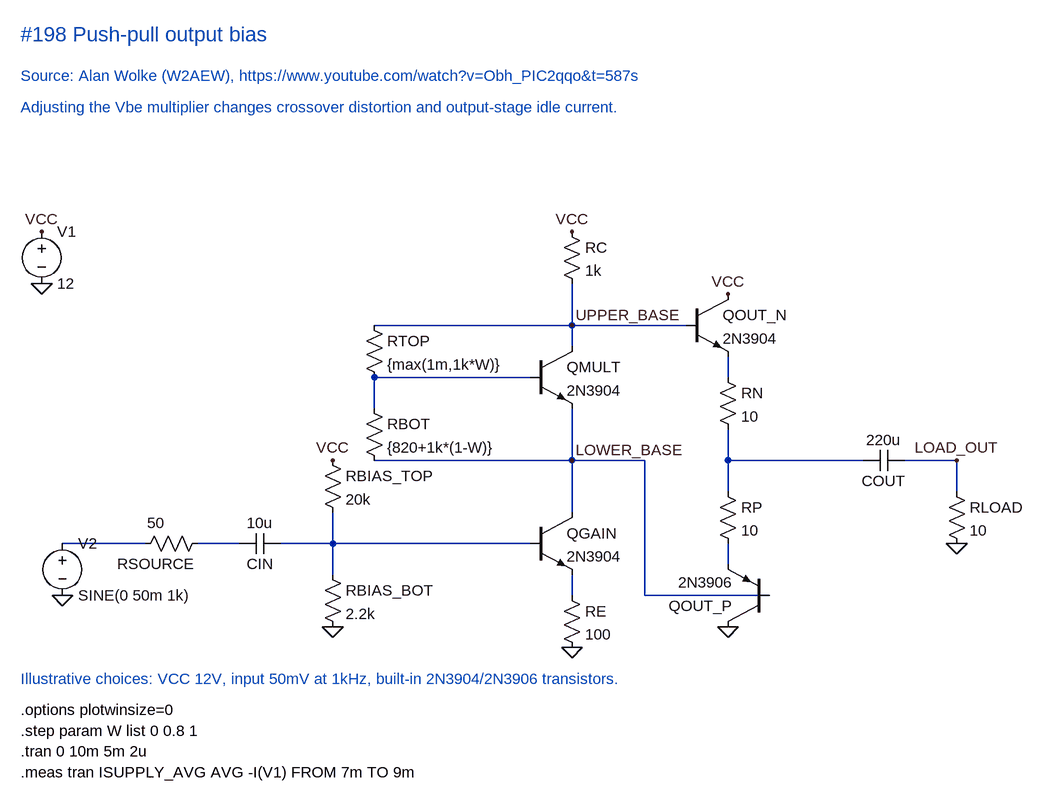
[diagram p0: schematic Push-pull output bias.asc]
Push-pull output bias.asc, the LTspice schematic file:
Version 4.1
SHEET 1 1800 1050
WIRE 256 608 128 608
WIRE 400 608 336 608
WIRE 544 608 464 608
WIRE 848 608 544 608
WIRE 544 608 544 560
WIRE 544 656 544 608
WIRE 912 272 912 208
WIRE 912 304 912 272
WIRE 912 272 608 272
WIRE 1088 272 912 272
WIRE 848 352 608 352
WIRE 608 400 608 352
WIRE 912 480 912 400
WIRE 912 480 608 480
WIRE 912 560 912 480
WIRE 912 688 912 656
WIRE 1024 480 912 480
WIRE 1024 688 1024 480
WIRE 1216 688 1024 688
WIRE 1152 352 1152 320
WIRE 1152 480 1152 432
WIRE 1152 528 1152 480
WIRE 1152 640 1152 608
WIRE 1248 480 1152 480
WIRE 1360 480 1248 480
WIRE 1504 480 1424 480
WIRE 1504 528 1504 480
FLAG 96 128 VCC
FLAG 96 208 0
FLAG 128 688 0
FLAG 544 480 VCC
FLAG 544 736 0
FLAG 912 128 VCC
FLAG 912 768 0
FLAG 1152 224 VCC
FLAG 1152 736 0
FLAG 1504 608 0
FLAG 912 272 UPPER_BASE
FLAG 912 480 LOWER_BASE
FLAG 1504 480 LOAD_OUT
SYMBOL voltage 96 112 R0
SYMATTR InstName V1
SYMATTR Value 12
SYMBOL voltage 128 592 R0
SYMATTR InstName V2
SYMATTR Value SINE(0 50m 1k)
SYMBOL res 240 624 R270
WINDOW 0 0 32 VBottom 2
WINDOW 3 32 32 VTop 2
SYMATTR InstName RSOURCE
SYMATTR Value 50
SYMBOL cap 400 624 R270
WINDOW 0 0 32 VBottom 2
WINDOW 3 32 32 VTop 2
SYMATTR InstName CIN
SYMATTR Value 10u
SYMBOL res 528 464 R0
SYMATTR InstName RBIAS_TOP
SYMATTR Value 20k
SYMBOL res 528 640 R0
SYMATTR InstName RBIAS_BOT
SYMATTR Value 2.2k
SYMBOL npn 848 560 R0
SYMATTR InstName QGAIN
SYMATTR Value 2N3904
SYMBOL res 896 672 R0
SYMATTR InstName RE
SYMATTR Value 100
SYMBOL res 896 112 R0
SYMATTR InstName RC
SYMATTR Value 1k
SYMBOL npn 848 304 R0
SYMATTR InstName QMULT
SYMATTR Value 2N3904
SYMBOL res 592 256 R0
SYMATTR InstName RTOP
SYMATTR Value {max(1m,1k*W)}
SYMBOL res 592 384 R0
SYMATTR InstName RBOT
SYMATTR Value {820+1k*(1-W)}
SYMBOL npn 1088 224 R0
SYMATTR InstName QOUT_N
SYMATTR Value 2N3904
SYMBOL res 1136 336 R0
SYMATTR InstName RN
SYMATTR Value 10
SYMBOL res 1136 512 R0
SYMATTR InstName RP
SYMATTR Value 10
SYMBOL pnp 1216 736 R180
SYMATTR InstName QOUT_P
SYMATTR Value 2N3906
SYMBOL cap 1360 496 R270
WINDOW 0 0 32 VBottom 2
WINDOW 3 32 32 VTop 2
SYMATTR InstName COUT
SYMATTR Value 220u
SYMBOL res 1488 512 R0
SYMATTR InstName RLOAD
SYMATTR Value 10
TEXT 64 -176 Left 3 ;#198 Push-pull output bias
TEXT 64 -112 Left 2 ;Source: Alan Wolke (W2AEW), https://www.youtube.com/watch?v=Obh_PIC2qqo&t=587s
TEXT 64 -64 Left 2 ;Adjusting the Vbe multiplier changes crossover distortion and output-stage idle current.
TEXT 64 816 Left 2 ;Illustrative choices: VCC 12V, input 50mV at 1kHz, built-in 2N3904/2N3906 transistors.
TEXT 64 864 Left 2 !.options plotwinsize=0
TEXT 64 896 Left 2 !.step param W list 0 0.8 1
TEXT 64 928 Left 2 !.tran 0 10m 5m 2u
TEXT 64 960 Left 2 !.meas tran ISUPPLY_AVG AVG -I(V1) FROM 7m TO 9m

The netlist it stands for:
* Push-pull output bias.asc
V1 VCC 0 12
V2 N001 0 SINE(0 50m 1k)
RSOURCE N001 N002 50
CIN N002 N003 10u
RBIAS_TOP VCC N003 20k
RBIAS_BOT N003 0 2.2k
QGAIN LOWER_BASE N003 N005 0 2N3904
RE N005 0 100
RC VCC UPPER_BASE 1k
QMULT UPPER_BASE N004 LOWER_BASE 0 2N3904
RTOP UPPER_BASE N004 {max(1m,1k*W)}
RBOT N004 LOWER_BASE {820+1k*(1-W)}
QOUT_N VCC UPPER_BASE N006 0 2N3904
RN N006 N007 10
RP N007 N008 10
QOUT_P 0 LOWER_BASE N008 0 2N3906
COUT N007 LOAD_OUT 220u
RLOAD LOAD_OUT 0 10
.model NPN NPN
.model PNP PNP
.lib standard.bjt
* #198 Push-pull output bias
* Source: Alan Wolke (W2AEW), https://www.youtube.com/watch?v=Obh_PIC2qqo&t=587s
* Adjusting the Vbe multiplier changes crossover distortion and output-stage idle current.
* Illustrative choices: VCC 12V, input 50mV at 1kHz, built-in 2N3904/2N3906 transistors.
.options plotwinsize=0
.step param W list 0 0.8 1
.tran 0 10m 5m 2u
.meas tran ISUPPLY_AVG AVG -I(V1) FROM 7m TO 9m
.backanno
.end